# Altium schematic sheet Top_Sheet.SchDoc
size A4; DocumentNumber: 7; SheetNumber: 1; SheetTotal: 10
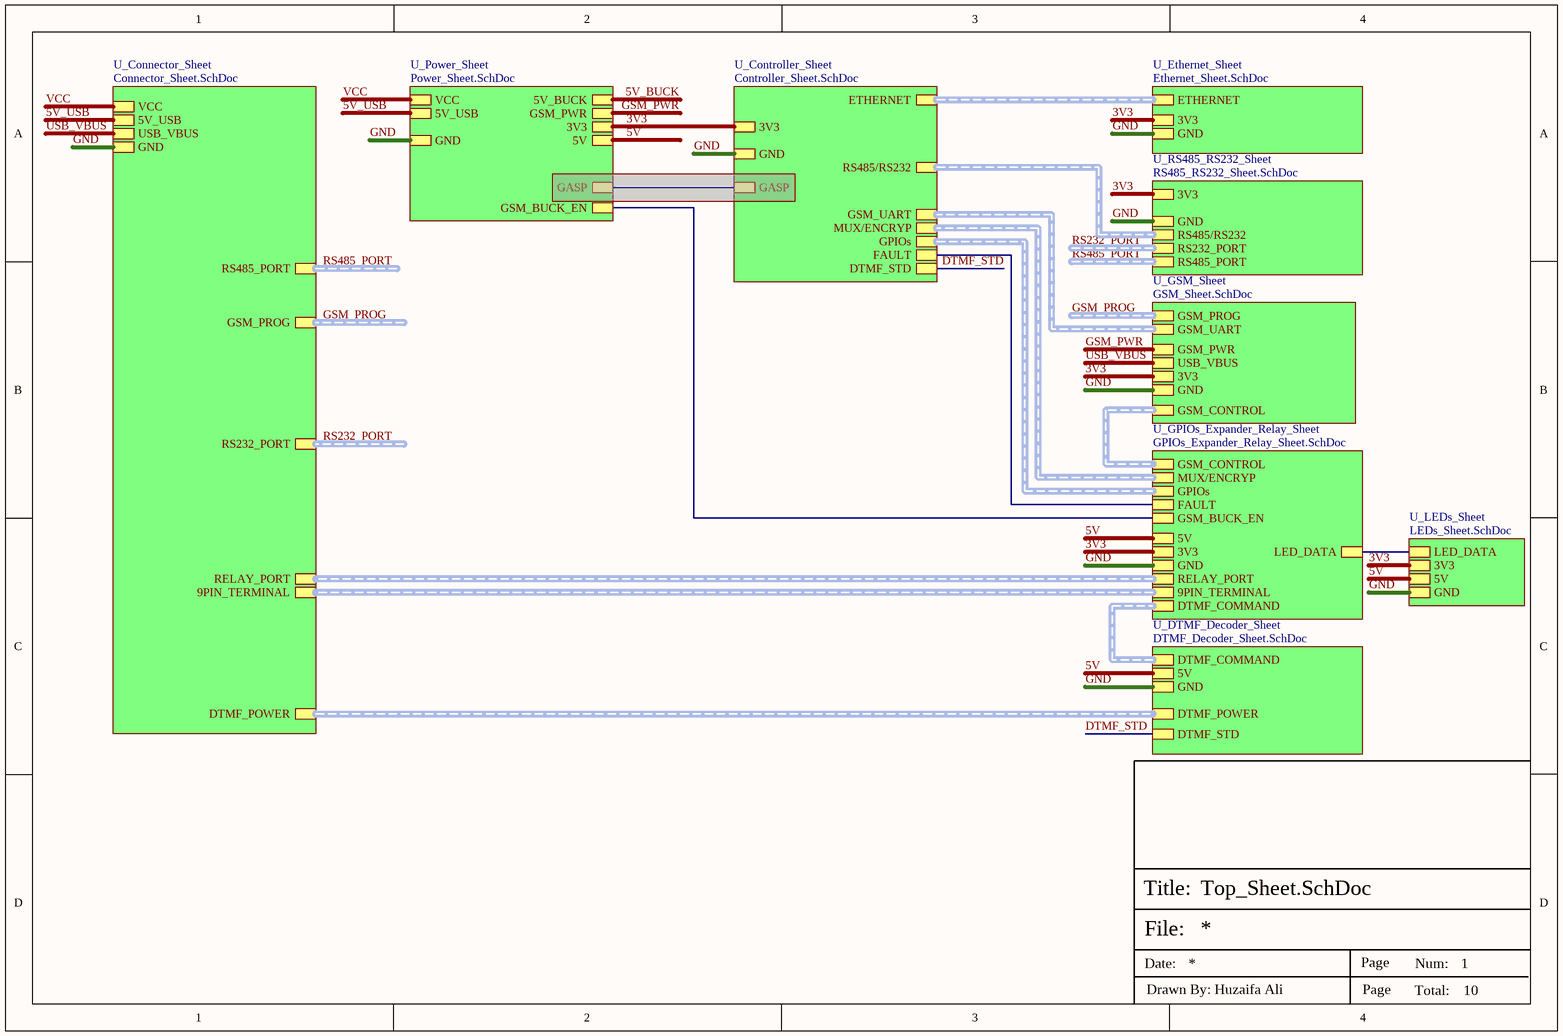
[diagram p0: Top_Sheet.SchDoc]

## Sub-sheets
U_Connector_Sheet = Connector_Sheet.SchDoc: VCC, GND, 5V_USB, USB_VBUS, GSM_PROG (harness GSM_PROG), RS485_PORT (harness RS485_PORT), RELAY_PORT (harness RELAY_PORT), 9PIN_TERMINAL (harness 9PIN_TERMINAL), DTMF_POWER (harness DTMF_POWER), RS232_PORT (harness RS232_PORT)
U_Controller_Sheet = Controller_Sheet.SchDoc: 3V3, GND, ETHERNET (harness ETHERNET), GSM_UART (harness GSM_UART), DTMF_STD, FAULT, GPIOs (harness GPIOs), GASP, RS485/RS232 (harness RS485/RS232), MUX/ENCRYP (harness MUX/ENCRYP)
U_DTMF_Decoder_Sheet = DTMF_Decoder_Sheet.SchDoc: DTMF_POWER (harness DTMF_POWER), 5V, GND, DTMF_COMMAND (harness DTMF_COMMAND), DTMF_STD
U_Ethernet_Sheet = Ethernet_Sheet.SchDoc: ETHERNET (harness ETHERNET), 3V3, GND
U_GPIOs_Expander_Relay_Sheet = GPIOs_Expander_Relay_Sheet.SchDoc: GPIOs (harness GPIOs), DTMF_COMMAND (harness DTMF_COMMAND), GSM_CONTROL (harness GSM_CONTROL), 9PIN_TERMINAL (harness 9PIN_TERMINAL), RELAY_PORT (harness RELAY_PORT), GSM_BUCK_EN, FAULT, 3V3, GND, 5V, MUX/ENCRYP (harness MUX/ENCRYP), LED_DATA
U_GSM_Sheet = GSM_Sheet.SchDoc: GSM_PWR, GND, GSM_PROG (harness GSM_PROG), 3V3, USB_VBUS, GSM_UART (harness GSM_UART), GSM_CONTROL (harness GSM_CONTROL)
U_LEDs_Sheet = LEDs_Sheet.SchDoc: LED_DATA, 3V3, GND, 5V
U_Power_Sheet = Power_Sheet.SchDoc: VCC, 5V_BUCK, GND, GSM_BUCK_EN, 5V_USB, GSM_PWR, 5V, 3V3, GASP
U_RS485_RS232_Sheet = RS485_RS232_Sheet.SchDoc: GND, RS485_PORT (harness RS485_PORT), RS232_PORT (harness RS232_PORT), RS485/RS232 (harness RS485/RS232), 3V3

## Nets
3V3: sheet U_Ethernet_Sheet/3V3, sheet U_Power_Sheet/3V3, sheet U_Controller_Sheet/3V3, sheet U_RS485_RS232_Sheet/3V3, sheet U_LEDs_Sheet/3V3, sheet U_GPIOs_Expander_Relay_Sheet/3V3, sheet U_GSM_Sheet/3V3
5V: sheet U_DTMF_Decoder_Sheet/5V, sheet U_Power_Sheet/5V, sheet U_LEDs_Sheet/5V, sheet U_GPIOs_Expander_Relay_Sheet/5V
5V_BUCK: sheet U_Power_Sheet/5V_BUCK
5V_USB: sheet U_Connector_Sheet/5V_USB, sheet U_Power_Sheet/5V_USB
DTMF_STD: sheet U_DTMF_Decoder_Sheet/DTMF_STD, sheet U_Controller_Sheet/DTMF_STD
GND: sheet U_Ethernet_Sheet/GND, sheet U_Connector_Sheet/GND, sheet U_DTMF_Decoder_Sheet/GND, sheet U_Power_Sheet/GND, sheet U_Controller_Sheet/GND, sheet U_RS485_RS232_Sheet/GND, sheet U_LEDs_Sheet/GND, sheet U_GPIOs_Expander_Relay_Sheet/GND, sheet U_GSM_Sheet/GND
GSM_PWR: sheet U_Power_Sheet/GSM_PWR, sheet U_GSM_Sheet/GSM_PWR
USB_VBUS: sheet U_Connector_Sheet/USB_VBUS, sheet U_GSM_Sheet/USB_VBUS
VCC: sheet U_Connector_Sheet/VCC, sheet U_Power_Sheet/VCC
(unnamed): sheet U_Power_Sheet/GSM_BUCK_EN, sheet U_GPIOs_Expander_Relay_Sheet/GSM_BUCK_EN
(unnamed): sheet U_Controller_Sheet/FAULT, sheet U_GPIOs_Expander_Relay_Sheet/FAULT
(unnamed): sheet U_LEDs_Sheet/LED_DATA, sheet U_GPIOs_Expander_Relay_Sheet/LED_DATA

## Buses and harness runs
harness GSM_PROG = sheet U_Connector_Sheet/GSM_PROG
harness GSM_PROG = sheet U_GSM_Sheet/GSM_PROG
harness RS232_PORT = sheet U_Connector_Sheet/RS232_PORT
harness RS232_PORT = sheet U_RS485_RS232_Sheet/RS232_PORT
harness RS485_PORT = sheet U_Connector_Sheet/RS485_PORT
harness RS485_PORT = sheet U_RS485_RS232_Sheet/RS485_PORT
harness sheet U_Connector_Sheet/9PIN_TERMINAL = sheet U_GPIOs_Expander_Relay_Sheet/9PIN_TERMINAL
harness sheet U_Connector_Sheet/DTMF_POWER = sheet U_DTMF_Decoder_Sheet/DTMF_POWER
harness sheet U_Connector_Sheet/RELAY_PORT = sheet U_GPIOs_Expander_Relay_Sheet/RELAY_PORT
harness sheet U_Controller_Sheet/ETHERNET = sheet U_Ethernet_Sheet/ETHERNET
harness sheet U_Controller_Sheet/GPIOs = sheet U_GPIOs_Expander_Relay_Sheet/GPIOs
harness sheet U_Controller_Sheet/GSM_UART = sheet U_GSM_Sheet/GSM_UART
harness sheet U_Controller_Sheet/MUX/ENCRYP = sheet U_GPIOs_Expander_Relay_Sheet/MUX/ENCRYP
harness sheet U_Controller_Sheet/RS485/RS232 = sheet U_RS485_RS232_Sheet/RS485/RS232
harness sheet U_DTMF_Decoder_Sheet/DTMF_COMMAND = sheet U_GPIOs_Expander_Relay_Sheet/DTMF_COMMAND
harness sheet U_GPIOs_Expander_Relay_Sheet/GSM_CONTROL = sheet U_GSM_Sheet/GSM_CONTROL

## Notes on the sheet
- File:
- Title:
- Date:
- Page
- Num:
- Total:
- Drawn By: Huzaifa Ali